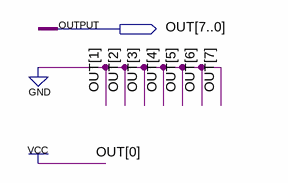
[diagram p0: schematic sheet]
// Quartus schematic One.bdf as structural Verilog: 0 symbols, 1 pins
module One (
  output [7:0] OUT
);


  assign OUT = 8'b00000001;
endmodule
